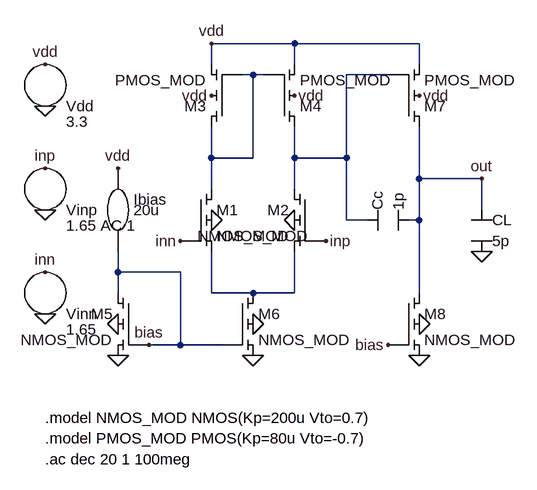
[diagram p0: schematic two_stage_opamp_drawn.asc]
two_stage_opamp_drawn.asc, the LTspice schematic file:
Version 4
SHEET 1 880 680
WIRE 320 96 320 64
WIRE 320 64 448 64
WIRE 448 64 448 96
WIRE 640 96 640 64
WIRE 640 64 448 64
WIRE 368 112 400 112
WIRE 320 192 320 288
WIRE 448 192 448 288
WIRE 320 240 384 240
WIRE 384 240 384 112
WIRE 320 384 320 448
WIRE 320 448 384 448
WIRE 448 384 448 448
WIRE 448 448 384 448
WIRE 224 528 336 528
WIRE 176 384 176 448
WIRE 176 416 272 416
WIRE 272 416 272 528
WIRE 448 240 528 240
WIRE 528 240 528 112
WIRE 528 112 592 112
WIRE 640 192 640 448
WIRE 560 336 528 336
WIRE 528 336 528 240
WIRE 624 336 640 336
WIRE 640 272 736 272
WIRE 736 272 736 320
FLAG 320 64 vdd
FLAG 736 272 out
FLAG 224 528 bias
FLAG 592 528 bias
FLAG 272 368 inn
FLAG 64 416 inn
FLAG 496 368 inp
FLAG 64 256 inp
FLAG 64 96 vdd
FLAG 176 256 vdd
FLAG 320 144 vdd
FLAG 448 144 vdd
FLAG 640 144 vdd
FLAG 64 160 0
FLAG 64 320 0
FLAG 64 480 0
FLAG 736 384 0
FLAG 320 336 0
FLAG 448 336 0
FLAG 176 544 0
FLAG 176 496 0
FLAG 384 544 0
FLAG 384 496 0
FLAG 640 544 0
FLAG 640 496 0
SYMBOL pmos4 368 192 R180
SYMATTR InstName M3
SYMATTR Value PMOS_MOD
SYMBOL pmos4 400 192 M180
SYMATTR InstName M4
SYMATTR Value PMOS_MOD
SYMBOL pmos4 592 192 M180
SYMATTR InstName M7
SYMATTR Value PMOS_MOD
SYMBOL nmos4 272 288 R0
SYMATTR InstName M1
SYMATTR Value NMOS_MOD
SYMBOL nmos4 496 288 M0
SYMATTR InstName M2
SYMATTR Value NMOS_MOD
SYMBOL nmos4 336 448 R0
SYMATTR InstName M6
SYMATTR Value NMOS_MOD
SYMBOL nmos4 224 448 M0
SYMATTR InstName M5
SYMATTR Value NMOS_MOD
SYMBOL current 176 304 R0
SYMATTR InstName Ibias
SYMATTR Value 20u
SYMBOL nmos4 592 448 R0
SYMATTR InstName M8
SYMATTR Value NMOS_MOD
SYMBOL cap 592 336 R270
SYMATTR InstName Cc
SYMATTR Value 1p
SYMBOL cap 736 352 R0
SYMATTR InstName CL
SYMATTR Value 5p
SYMBOL voltage 64 128 R0
SYMATTR InstName Vdd
SYMATTR Value 3.3
SYMBOL voltage 64 288 R0
SYMATTR InstName Vinp
SYMATTR Value 1.65 AC 1
SYMBOL voltage 64 448 R0
SYMATTR InstName Vinn
SYMATTR Value 1.65
TEXT 64 640 Left 2 !.model NMOS_MOD NMOS(Kp=200u Vto=0.7)
TEXT 64 672 Left 2 !.model PMOS_MOD PMOS(Kp=80u Vto=-0.7)
TEXT 64 704 Left 2 !.ac dec 20 1 100meg

The netlist it stands for:
* two_stage_opamp_drawn.asc
M3 N001 N001 vdd vdd PMOS_MOD
M4 N002 N001 vdd vdd PMOS_MOD
M7 out N002 vdd vdd PMOS_MOD
M1 N001 inn N003 0 NMOS_MOD
M2 N002 inp N003 0 NMOS_MOD
M6 N003 bias 0 0 NMOS_MOD
M5 bias bias 0 0 NMOS_MOD
Ibias vdd bias 20u
M8 out bias 0 0 NMOS_MOD
Cc N002 out 1p
CL out 0 5p
Vdd vdd 0 3.3
Vinp inp 0 1.65 AC 1
Vinn inn 0 1.65
.model NMOS NMOS
.model PMOS PMOS
.lib standard.mos
.model NMOS_MOD NMOS(Kp=200u Vto=0.7)
.model PMOS_MOD PMOS(Kp=80u Vto=-0.7)
.ac dec 20 1 100meg
.backanno
.end